# Altium schematic sheet Whisper_Power.SchDoc
size A4; SheetNumber: 2; SheetTotal: 4
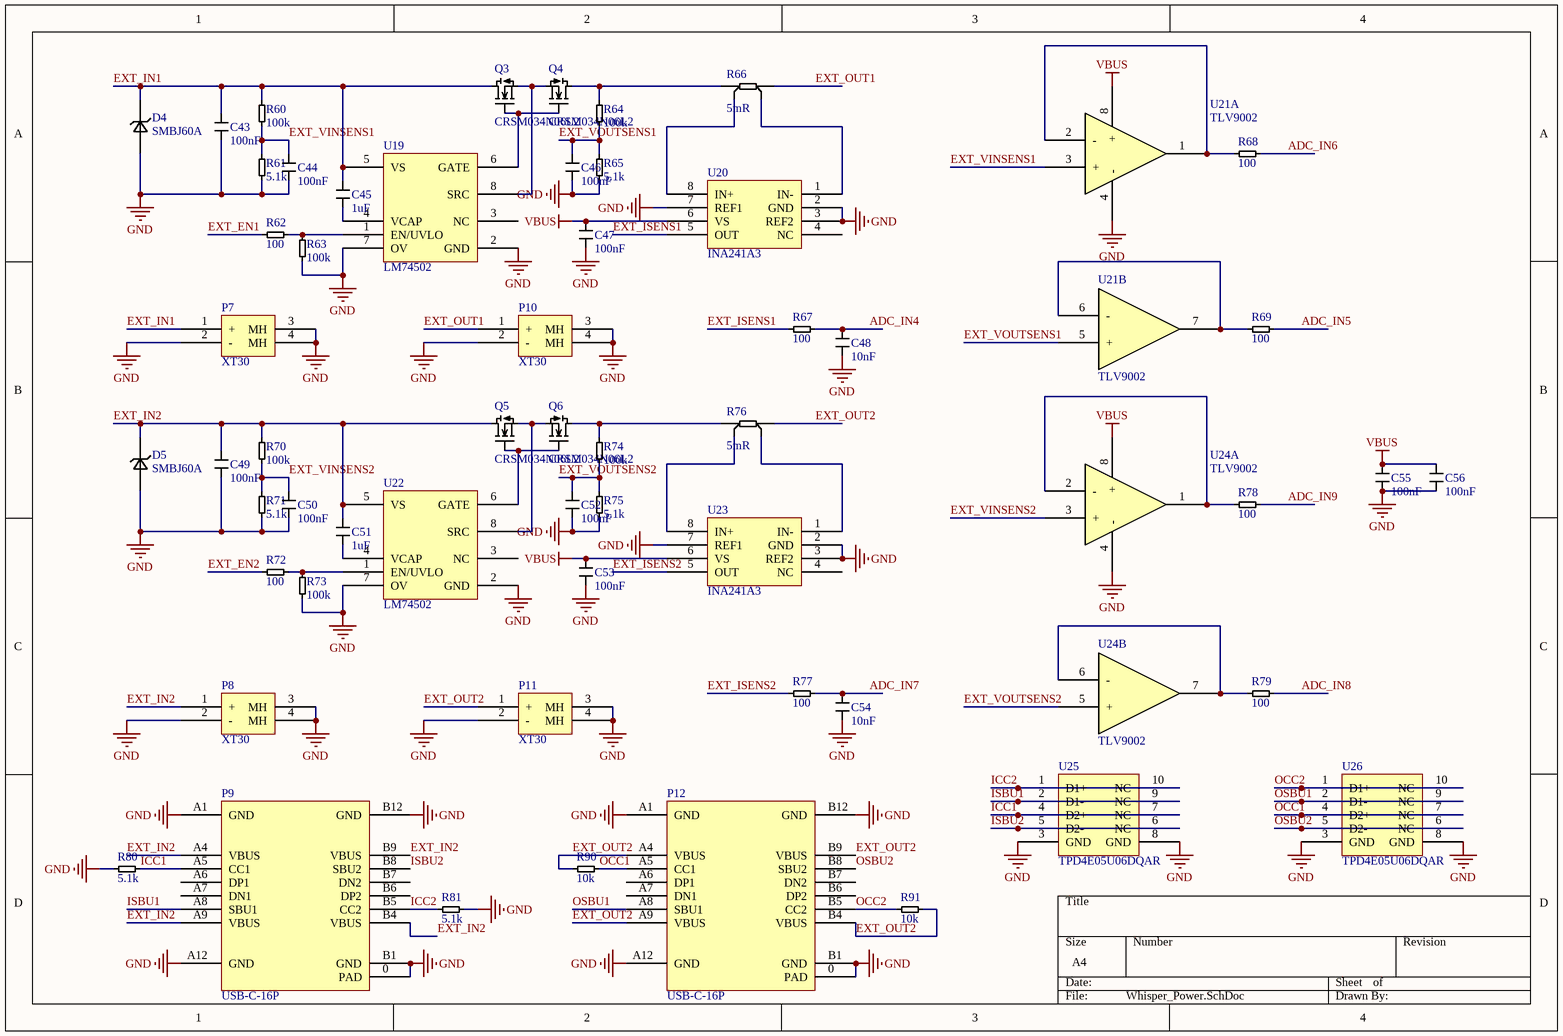
[diagram p0: Whisper_Power.SchDoc]

## Parts
C43  100nF  [0603-Cap]
C44  100nF  [0603-Cap]
C45  1uF  [0603-Cap]
C46  100nF  [0603-Cap]
C47  100nF  [0603-Cap]
C48  10nF  [0603-Cap]
C49  100nF  [0603-Cap]
C50  100nF  [0603-Cap]
C51  1uF  [0603-Cap]
C52  100nF  [0603-Cap]
C53  100nF  [0603-Cap]
C54  10nF  [0603-Cap]
C55  100nF  [0603-Cap]
C56  100nF  [0603-Cap]
D4  SMBJ60A  [SMB (DO-214AA)]
D5  SMBJ60A  [SMB (DO-214AA)]
P7  XT30  [XT30PW-M30]
P8  XT30  [XT30PW-M30]
P9  USB-C-16P  [USB-C-16P]
P10  XT30  [XT30PW-F30]
P11  XT30  [XT30PW-F30]
P12  USB-C-16P  [USB-C-16P]
Q3  CRSM034N06L2  [DFN5x6-MOS]
Q4  CRSM034N06L2  [DFN5x6-MOS]
Q5  CRSM034N06L2  [DFN5x6-MOS]
Q6  CRSM034N06L2  [DFN5x6-MOS]
R60  100k  [0603]
R61  5.1k  [0603]
R62  100  [0603]
R63  100k  [0603]
R64  100k  [0603]
R65  5.1k  [0603]
R66  5mR  [2512 - 4W]
R67  100  [0603]
R68  100  [0603]
R69  100  [0603]
R70  100k  [0603]
R71  5.1k  [0603]
R72  100  [0603]
R73  100k  [0603]
R74  100k  [0603]
R75  5.1k  [0603]
R76  5mR  [2512 - 4W]
R77  100  [0603]
R78  100  [0603]
R79  100  [0603]
R80  5.1k  [0603]
R81  5.1k  [0603]
R90  10k  [0603]
R91  10k  [0603]
U19  LM74502  [SOT23-8]
U20  INA241A3  [SOT23-8]
U21  TLV9002  [MSOP8]  (parts A,B of 2)
U22  LM74502  [SOT23-8]
U23  INA241A3  [SOT23-8]
U24  TLV9002  [MSOP8]  (parts A,B of 2)
U25  TPD4E05U06DQAR  [SON-10-DQA]
U26  TPD4E05U06DQAR  [SON-10-DQA]

## Nets
GND: C43.1 C44.1 C46.1 C47.1 C48.1 C49.1 C50.1 C52.1 C53.1 C54.1 C55.1 C56.1 D4.1 D5.1 P7.2(-) P7.3(MH) P7.4(MH) P8.2(-) P8.3(MH) P8.4(MH) P9.0(PAD) P9.A1(GND) P9.A12(GND) P9.B1(GND) P9.B12(GND) P10.2(-) P10.3(MH) P10.4(MH) P11.2(-) P11.3(MH) P11.4(MH) P12.0(PAD) P12.A1(GND) P12.A12(GND) P12.B1(GND) P12.B12(GND) R61.2 R63.2 R65.2 R71.2 R73.2 R75.2 R80.1 R81.1 U19.2(GND) U19.7(OV) U20.2(GND) U20.3(REF2) U20.7(REF1) U21.4(-) U22.2(GND) U22.7(OV) U23.2(GND) U23.3(REF2) U23.7(REF1) U24.4(-) U25.3(GND) U25.8(GND) U26.3(GND) U26.8(GND)
VBUS: C47.2 C53.2 C55.2 C56.2 U20.6(VS) U21.8(+) U23.6(VS) U24.8(+)
ADC_IN4: C48.2 R67.1
ADC_IN5: R69.1
ADC_IN6: R68.1
ADC_IN7: C54.2 R77.1
ADC_IN8: R79.1
ADC_IN9: R78.1
EXT_EN1: R62.1
EXT_EN2: R72.1
EXT_IN1: C43.2 C45.2 D4.2 P7.1(+) Q3.3(D) R60.1 U19.5(VS)
EXT_IN2: C49.2 C51.2 D5.2 P8.1(+) P9.A4(VBUS) P9.A9(VBUS) P9.B4(VBUS) P9.B9(VBUS) Q5.3(D) R70.1 U22.5(VS)
EXT_ISENS1: R67.2 U20.5(OUT)
EXT_ISENS2: R77.2 U23.5(OUT)
EXT_OUT1: P10.1(+) R66.2
EXT_OUT2: P11.1(+) P12.A4(VBUS) P12.A9(VBUS) P12.B4(VBUS) P12.B9(VBUS) R76.2 R90.2 R91.1
EXT_VINSENS1: C44.2 R60.2 R61.1 U21.3(+)
EXT_VINSENS2: C50.2 R70.2 R71.1 U24.3(+)
EXT_VOUTSENS1: C46.2 R64.2 R65.1 U21.5(+)
EXT_VOUTSENS2: C52.2 R74.2 R75.1 U24.5(+)
ICC1: P9.A5(CC1) R80.2 U25.4(D2+) U25.7(NC)
ICC2: P9.B5(CC2) R81.2 U25.1(D1+) U25.10(NC)
ISBU1: P9.A8(SBU1) U25.2(D1-) U25.9(NC)
ISBU2: P9.B8(SBU2) U25.5(D2-) U25.6(NC)
OCC1: P12.A5(CC1) R90.1 U26.4(D2+) U26.7(NC)
OCC2: P12.B5(CC2) R91.2 U26.1(D1+) U26.10(NC)
OSBU1: P12.A8(SBU1) U26.2(D1-) U26.9(NC)
OSBU2: P12.B8(SBU2) U26.5(D2-) U26.6(NC)
NetC45_1: C45.1 U19.4(VCAP)
NetC51_1: C51.1 U22.4(VCAP)
NetQ3_1: Q3.1(G) Q4.1(G) U19.6(GATE)
NetQ3_2: Q3.2(S) Q4.2(S) U19.8(SRC)
NetQ4_3: Q4.3(D) R64.1 R66.1
NetQ5_1: Q5.1(G) Q6.1(G) U22.6(GATE)
NetQ5_2: Q5.2(S) Q6.2(S) U22.8(SRC)
NetQ6_3: Q6.3(D) R74.1 R76.1
NetR62_2: R62.2 R63.1 U19.1(EN/UVLO)
NetR66_3: R66.3 U20.8(IN+)
NetR66_4: R66.4 U20.1(IN-)
NetR68_2: R68.2 U21.1 U21.2(-)
NetR69_2: R69.2 U21.6(-) U21.7
NetR72_2: R72.2 R73.1 U22.1(EN/UVLO)
NetR76_3: R76.3 U23.8(IN+)
NetR76_4: R76.4 U23.1(IN-)
NetR78_2: R78.2 U24.1 U24.2(-)
NetR79_2: R79.2 U24.6(-) U24.7

Not connected (* = marked no-connect by the designer): P9 A6(DP1) A7(DN1) B6(DP2) B7(DN2); P12 A6(DP1) A7(DN1) B6(DP2) B7(DN2); U19 3(NC); U20 4(NC); U22 3(NC); U23 4(NC)

## Library data of the parts
C43-C56 = Cap
D4 D5 = TVS
P9 P12 = USB-C-16P: TYPE-C 16PIN 2MD(073)
Q3-Q6 = NMOS-D: C467174
R60-R65 R67-R75 R77-R81 R90 R91 = Res
R66 R76 = RES-4W
U20 U23 = INA241
U21 U24 = ADA4077-2
U25 U26 = TPD4E